# Altium schematic sheet ESP32_Sheet.SchDoc (part 1 of 2)
size 420 x 297 mm; SheetNumber: 3; SheetTotal: 9
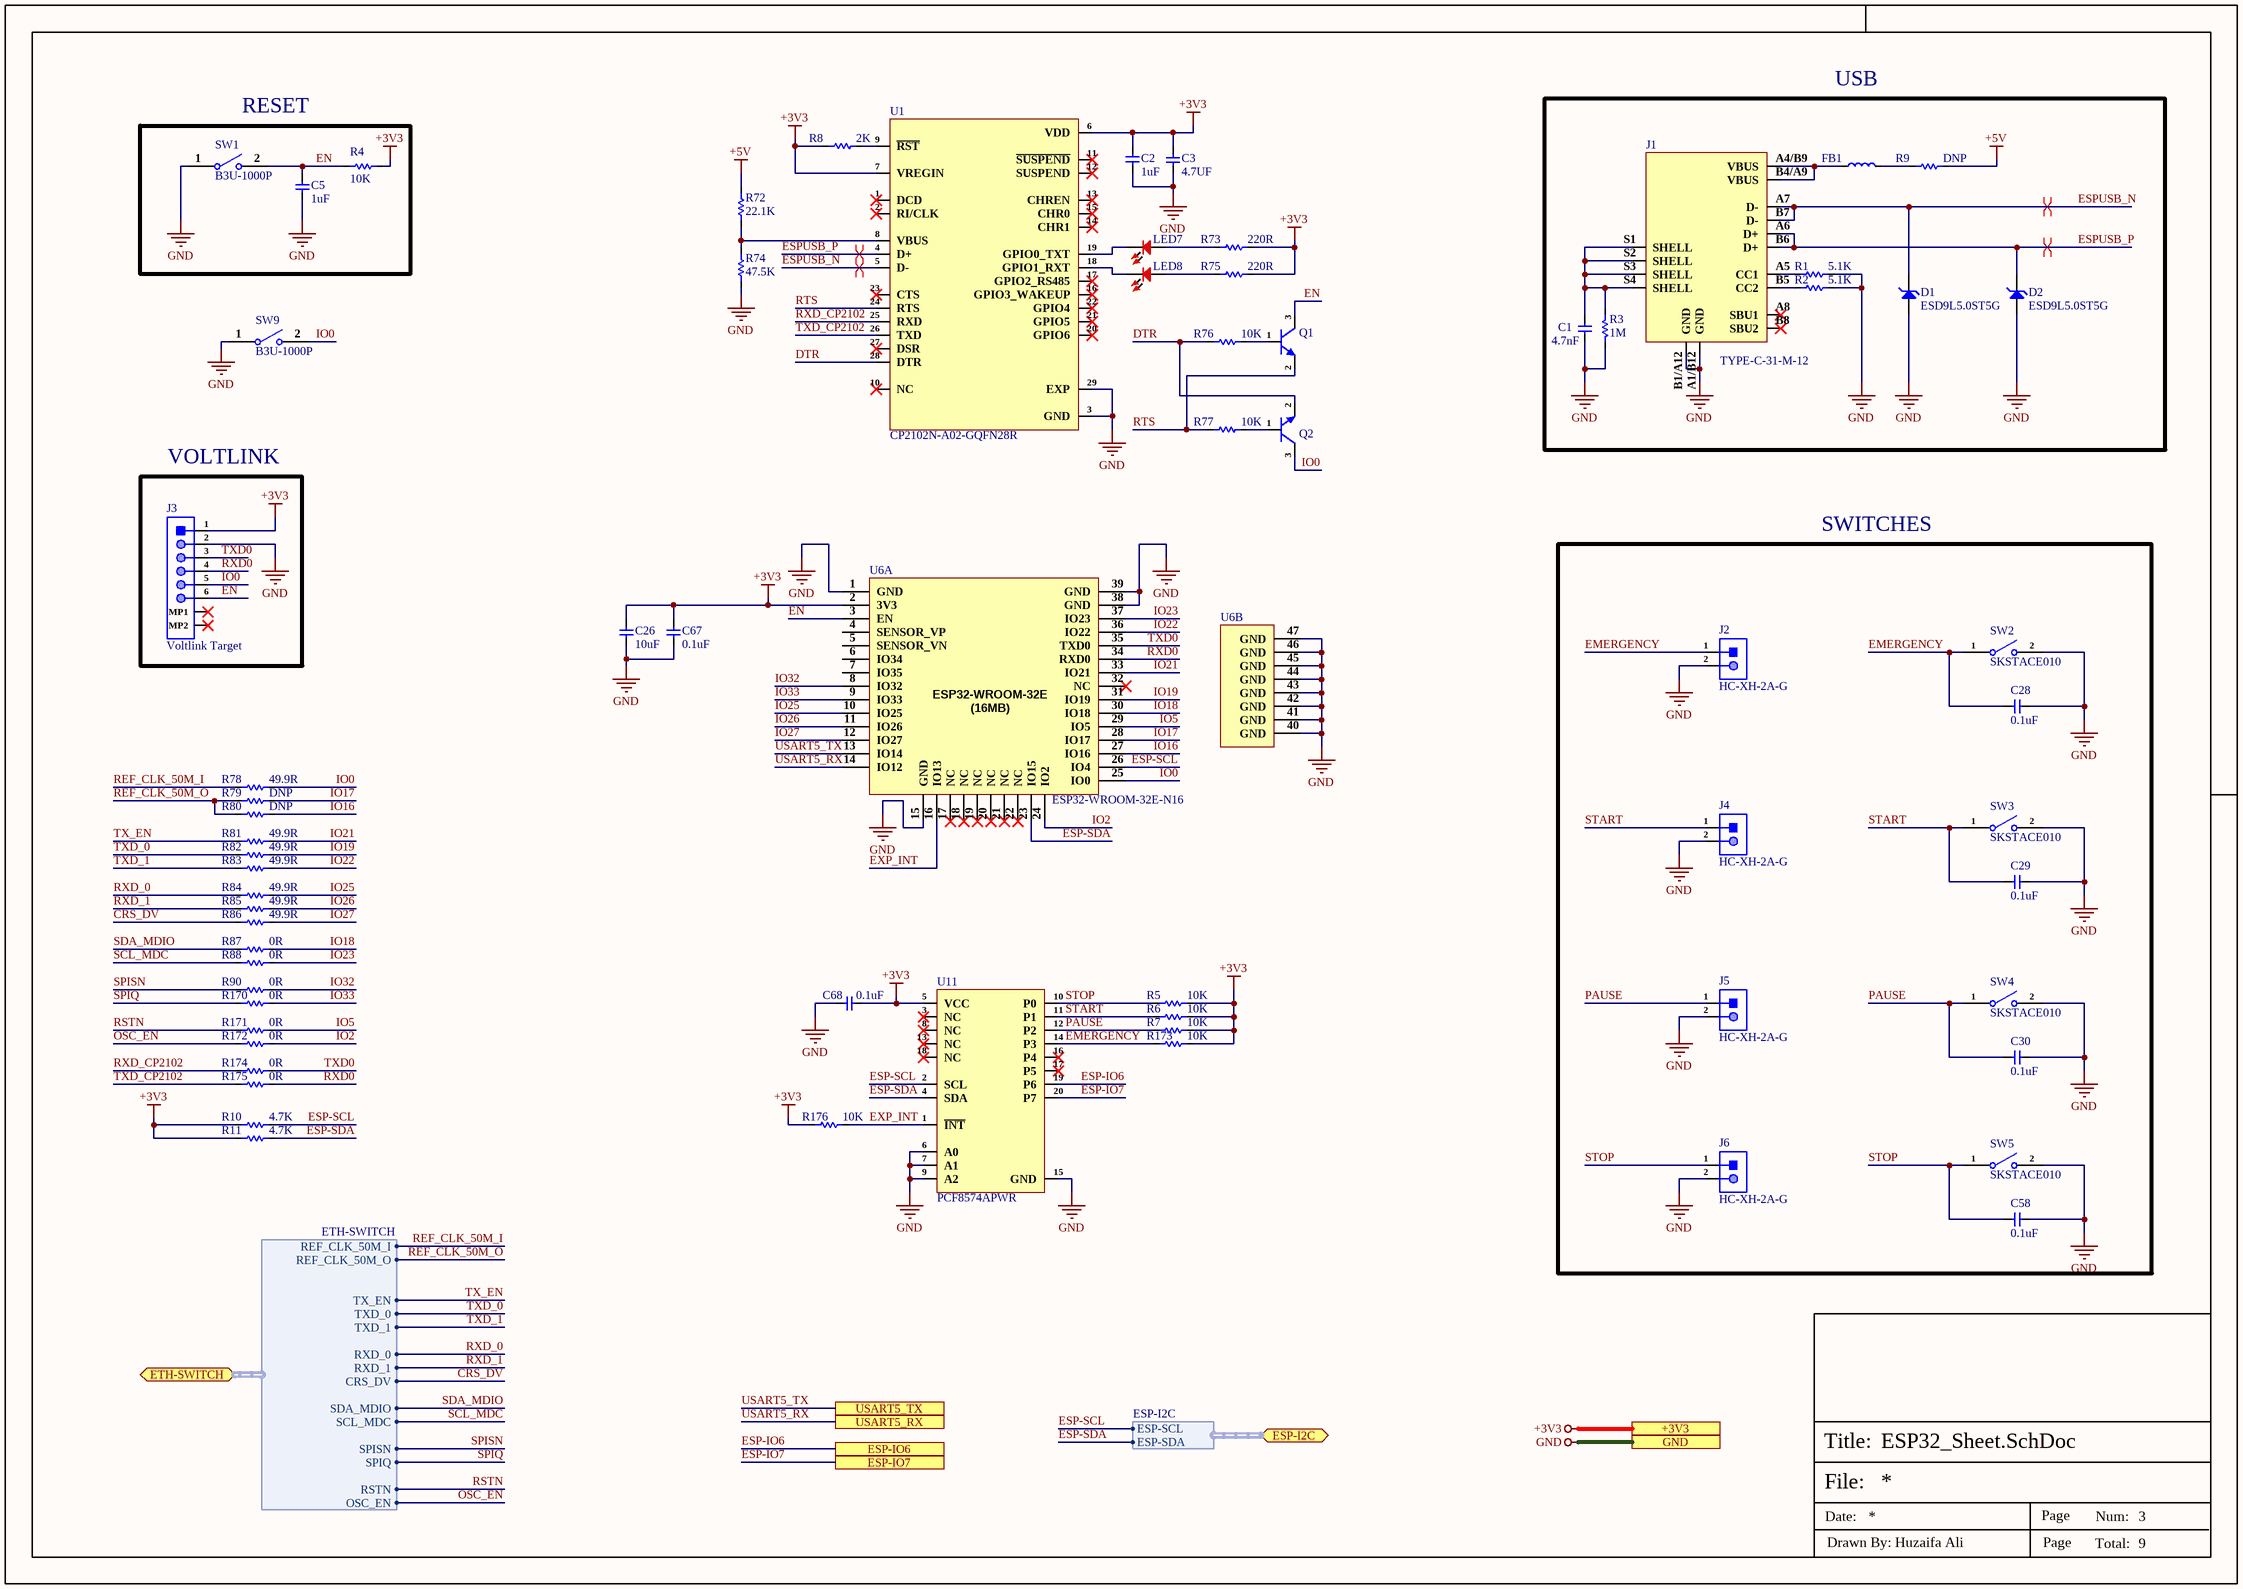
[diagram p0: ESP32_Sheet.SchDoc]

## Parts
C1  4.7nF  [Cap-0603]
C2  1uF  [Cap-0402]
C3  4.7UF  [Cap-0603]
C5  1uF  [Cap-0402]
C26  10uF  [Cap-0603]
C28  0.1uF  [Cap-0402]
C29  0.1uF  [Cap-0402]
C30  0.1uF  [Cap-0402]
C58  0.1uF  [Cap-0402]
C67  0.1uF  [Cap-0402]
C68  0.1uF  [Cap-0402]
D1  ESD9L5.0ST5G  [SOD-923.]
D2  ESD9L5.0ST5G  [SOD-923.]
FB1  BLM18PG221SN1D  [IND-0603 (1608 Metric)]  (value not drawn)
J1  TYPE-C-31-M-12  [TYPE-C-31-M-12_]
J2  HC-XH-2A-G  [HC-XH-2A-G]
J3  Voltlink Target  [Voltlink Target]
J4  HC-XH-2A-G  [HC-XH-2A-G]
J5  HC-XH-2A-G  [HC-XH-2A-G]
J6  HC-XH-2A-G  [HC-XH-2A-G]
LED7  RED  [LED-0603]  (value not drawn)
LED8  RED  [LED-0603]  (value not drawn)
Q1  SS8050-G  [SOT-23]  (value not drawn)
Q2  SS8050-G  [SOT-23]  (value not drawn)
R1  5.1K  [Res-0402]
R2  5.1K  [Res-0402]
R3  1M  [Res-0402]
R4  10K  [Res-0402]
R5  10K  [Res-0402]
R6  10K  [Res-0402]
R7  10K  [Res-0402]
R8  2K  [Res-0402]
R9  DNP  [Res-0402]
R10  4.7K  [Res-0402]
R11  4.7K  [Res-0402]
R72  22.1K  [Res-0603]
R73  220R  [Res-0603]
R74  47.5K  [Res-0603]
R75  220R  [Res-0603]
R76  10K  [Res-0402]
R77  10K  [Res-0402]
R78  49.9R  [Res-0603]
R79  DNP  [Res-0603]
R80  DNP  [Res-0603]
R81  49.9R  [Res-0603]
R82  49.9R  [Res-0603]
R83  49.9R  [Res-0603]
R84  49.9R  [Res-0603]
R85  49.9R  [Res-0603]
R86  49.9R  [Res-0603]
R87  0R  [Res-0603]
R88  0R  [Res-0603]
R90  0R  [Res-0603]
R170  0R  [Res-0603]
R171  0R  [Res-0603]
R172  0R  [Res-0603]
R173  10K  [Res-0402]
R174  0R  [Res-0603]
R175  0R  [Res-0603]
R176  10K  [Res-0402]
SW1  B3U-1000P  [B3U-1000P]
SW2  SKSTACE010  [SKSTACE010_]
SW3  SKSTACE010  [SKSTACE010_]
SW4  SKSTACE010  [SKSTACE010_]
SW5  SKSTACE010  [SKSTACE010_]
SW9  B3U-1000P  [B3U-1000P]
U1  CP2102N-A02-GQFN28R  [28-QFN (5x5)_]
U6  ESP32-WROOM-32E-N16  [38-SMD Module]  (parts A,B of 2)
U11  PCF8574APWR  [TSSOP-20]

## Blocks framed on the sheet
USB: C1 D1 D2 FB1 J1 R1-R3 R9
RESET: C5 R4 SW1
VOLTLINK: J3
SWITCHES: C28-C30 C58 J2 J4-J6 SW2-SW5

## Ports
+3V3 (see Top-Sheet[3A], CAN_Sheet[5D], EtherCAT_Sheet[5D], Ethernet_Sheet[5D], Power_Sheet[5D], RS485_RS232_Sheet[5D], STM32_Sheet[5D], TFT_Display_Sheet[5D]), ESP-I2C (bidir, harness ESP-I2C, see Top-Sheet[3B], TFT_Display_Sheet[2D]), ESP-IO6 (see Top-Sheet[3B], STM32_Sheet[4D]), ESP-IO7 (see Top-Sheet[3B], STM32_Sheet[4D]), ETH-SWITCH (bidir, harness ETH-SWITCH, see Top-Sheet[3B], Ethernet_Sheet[1D]), GND (see Top-Sheet[3A], CAN_Sheet[5D], EtherCAT_Sheet[5D], Ethernet_Sheet[5D], Power_Sheet[5D], RS485_RS232_Sheet[5D], STM32_Sheet[5D], TFT_Display_Sheet[5D]), USART5_RX (see Top-Sheet[3B], STM32_Sheet[4D]), USART5_TX (see Top-Sheet[3B], STM32_Sheet[4D])

## Harnesses
ESP-I2C: ESP-SCL, ESP-SDA
ETH-SWITCH: REF_CLK_50M_I, REF_CLK_50M_O, TX_EN, TXD_0, TXD_1, RXD_0, RXD_1, CRS_DV, SDA_MDIO, SCL_MDC, SPISN, SPIQ, RSTN, OSC_EN

## Nets
+3V3: C2.1 C3.2 C26.2 C67.2 C68.1 J3.1 R4.2 R5.2 R6.2 R7.2 R8.1 R10.2 R11.2 R73.2 R75.2 R173.2 R176.1 U1.6(VDD) U1.7(VREGIN) U6.2(3V3) U11.5(VCC) ; port +3V3
+5V: R9.2 R72.1
GND: C1.1 C2.2 C3.1 C5.1 C26.1 C28.1 C29.1 C30.1 C58.1 C67.1 C68.2 D1.2(A) D2.2(A) J1.A1/B12(GND) J1.B1/A12(GND) J2.2 J3.2 J4.2 J5.2 J6.2 R1.2 R2.2 R3.2 R74.1 SW1.1 SW2.2 SW3.2 SW4.2 SW5.2 SW9.1 U1.3(GND) U1.29(EXP) U6.1(GND) U6.15(GND) U6.38(GND) U6.39(GND) U6.40(GND) U6.41(GND) U6.42(GND) U6.43(GND) U6.44(GND) U6.45(GND) U6.46(GND) U6.47(GND) U11.6(A0) U11.7(A1) U11.9(A2) U11.15(GND) ; port GND
CRS_DV: R86.1 ; port ETH-SWITCH.CRS_DV
DTR: Q2.2(E) R76.1 U1.28(DTR)
EMERGENCY: C28.2 J2.1 R173.1 SW2.1 U11.14(P3)
EN: C5.2 J3.6 Q1.3(C) R4.1 SW1.2 U6.3(EN)
ESP-IO6: U11.19(P6) ; port ESP-IO6
ESP-IO7: U11.20(P7) ; port ESP-IO7
ESP-SCL: R10.1 U6.26(IO4) U11.2(SCL) ; port ESP-I2C.ESP-SCL
ESP-SDA: R11.1 U6.23(IO15) U11.4(SDA) ; port ESP-I2C.ESP-SDA
ESPUSB_N: D1.1(K) J1.A7(D-) J1.B7(D-) U1.5(D-)
ESPUSB_P: D2.1(K) J1.A6(D+) J1.B6(D+) U1.4(D+)
EXP_INT: R176.2 U6.16(IO13) U11.1(~{INT})
IO0: J3.5 Q2.3(C) R78.2 SW9.2 U6.25(IO0)
IO2: R172.2 U6.24(IO2)
IO5: R171.2 U6.29(IO5)
IO16: R80.2 U6.27(IO16)
IO17: R79.2 U6.28(IO17)
IO18: R87.2 U6.30(IO18)
IO19: R82.2 U6.31(IO19)
IO21: R81.2 U6.33(IO21)
IO22: R83.2 U6.36(IO22)
IO23: R88.2 U6.37(IO23)
IO25: R84.2 U6.10(IO25)
IO26: R85.2 U6.11(IO26)
IO27: R86.2 U6.12(IO27)
IO32: R90.2 U6.8(IO32)
IO33: R170.2 U6.9(IO33)
OSC_EN: R172.1 ; port ETH-SWITCH.OSC_EN
PAUSE: C30.2 J5.1 R7.1 SW4.1 U11.12(P2)
REF_CLK_50M_I: R78.1 ; port ETH-SWITCH.REF_CLK_50M_I
REF_CLK_50M_O: R79.1 R80.1 ; port ETH-SWITCH.REF_CLK_50M_O
RSTN: R171.1 ; port ETH-SWITCH.RSTN
RTS: Q1.2(E) R77.1 U1.24(RTS)
RXD0: J3.4 R175.2 U6.34(RXD0)
RXD_0: R84.1 ; port ETH-SWITCH.RXD_0
RXD_1: R85.1 ; port ETH-SWITCH.RXD_1
RXD_CP2102: R174.1 U1.25(RXD)
SCL_MDC: R88.1 ; port ETH-SWITCH.SCL_MDC
SDA_MDIO: R87.1 ; port ETH-SWITCH.SDA_MDIO
SPIQ: R170.1 ; port ETH-SWITCH.SPIQ
SPISN: R90.1 ; port ETH-SWITCH.SPISN
START: C29.2 J4.1 R6.1 SW3.1 U11.11(P1)
STOP: C58.2 J6.1 R5.1 SW5.1 U11.10(P0)
TX_EN: R81.1 ; port ETH-SWITCH.TX_EN
TXD0: J3.3 R174.2 U6.35(TXD0)
TXD_0: R82.1 ; port ETH-SWITCH.TXD_0
TXD_1: R83.1 ; port ETH-SWITCH.TXD_1
TXD_CP2102: R175.1 U1.26(TXD)
USART5_RX: U6.14(IO12) ; port USART5_RX
USART5_TX: U6.13(IO14) ; port USART5_TX
NetC1_2: C1.2 J1.S1(SHELL) J1.S2(SHELL) J1.S3(SHELL) J1.S4(SHELL) R3.1
NetFB1_1: FB1.1 J1.A4/B9(VBUS) J1.B4/A9(VBUS)
NetFB1_2: FB1.2 R9.1
NetJ1_A5: J1.A5(CC1) R1.1
NetJ1_B5: J1.B5(CC2) R2.1
NetLED7_1: LED7.1 R73.1
NetLED7_2: LED7.2 U1.19(GPIO0_TXT)
NetLED8_1: LED8.1 R75.1
NetLED8_2: LED8.2 U1.18(GPIO1_RXT)
NetQ1_1: Q1.1(B) R76.2
NetQ2_1: Q2.1(B) R77.2
NetR8_2: R8.2 U1.9(~{RST})
NetR72_2: R72.2 R74.2 U1.8(VBUS)

Not connected (* = marked no-connect by the designer): J1 A8(SBU1)* B8(SBU2)*; J3 MP1* MP2*; U1 1(DCD)* 2(RI/CLK)* 10(NC)* 11(~{SUSPEND})* 12(SUSPEND)* 13(CHREN)* 14(CHR1)* 15(CHR0)* 16(GPIO3_WAKEUP)* 17(GPIO2_RS485)* 20(GPIO6)* 21(GPIO5)* 22(GPIO4)* 23(CTS)* 27(DSR)*; U6 4(SENSOR_VP) 5(SENSOR_VN) 6(IO34) 7(IO35) 17(NC)* 18(NC)* 19(NC)* 20(NC)* 21(NC)* 22(NC)* 32(NC)*; U11 3(NC)* 8(NC)* 13(NC)* 16(P4)* 17(P5)* 18(NC)*

## Layout directives
differential pair; net class USB_PROGRAM; differential pair class USB_PROGRAM_LINES; rule Impedance Constraint [Min = 85.00    Max = 90.00    ]; rule Matched Net Lengths [Tolerance = 50mil]: ESPUSB_N, ESPUSB_P
differential pair; net class USB; differential pair class USB_Lines; rule Impedance Constraint [Min = 85.00    Max = 90.00    ]; rule Matched Net Lengths [Tolerance = 50mil]: ESPUSB_N, ESPUSB_P

## Notes on the sheet
- File:
- Title:
- Date:
- Page
- Num:
- Total:
- Drawn By: Huzaifa Ali
- (in symbol ESP32-WROOM-32E-N16, part A) ESP32-WROOM-32E (16MB) /